# EasyEDA Pro project ProPrj_CactusConKids14_2026-02-14.epro, schematic Schematic1

## Sheets
1 1. MCU and Power: Board Name: CCK14 Fallback; Create Date: 2025-12-13; Page Name: 1. MCU and Power; Project Name: CactusConKids14; Schematic Name: Schematic1; Update Date: 2025-12-14; Company: EasyEDA.com; Page Size: A4; Version: V1.0
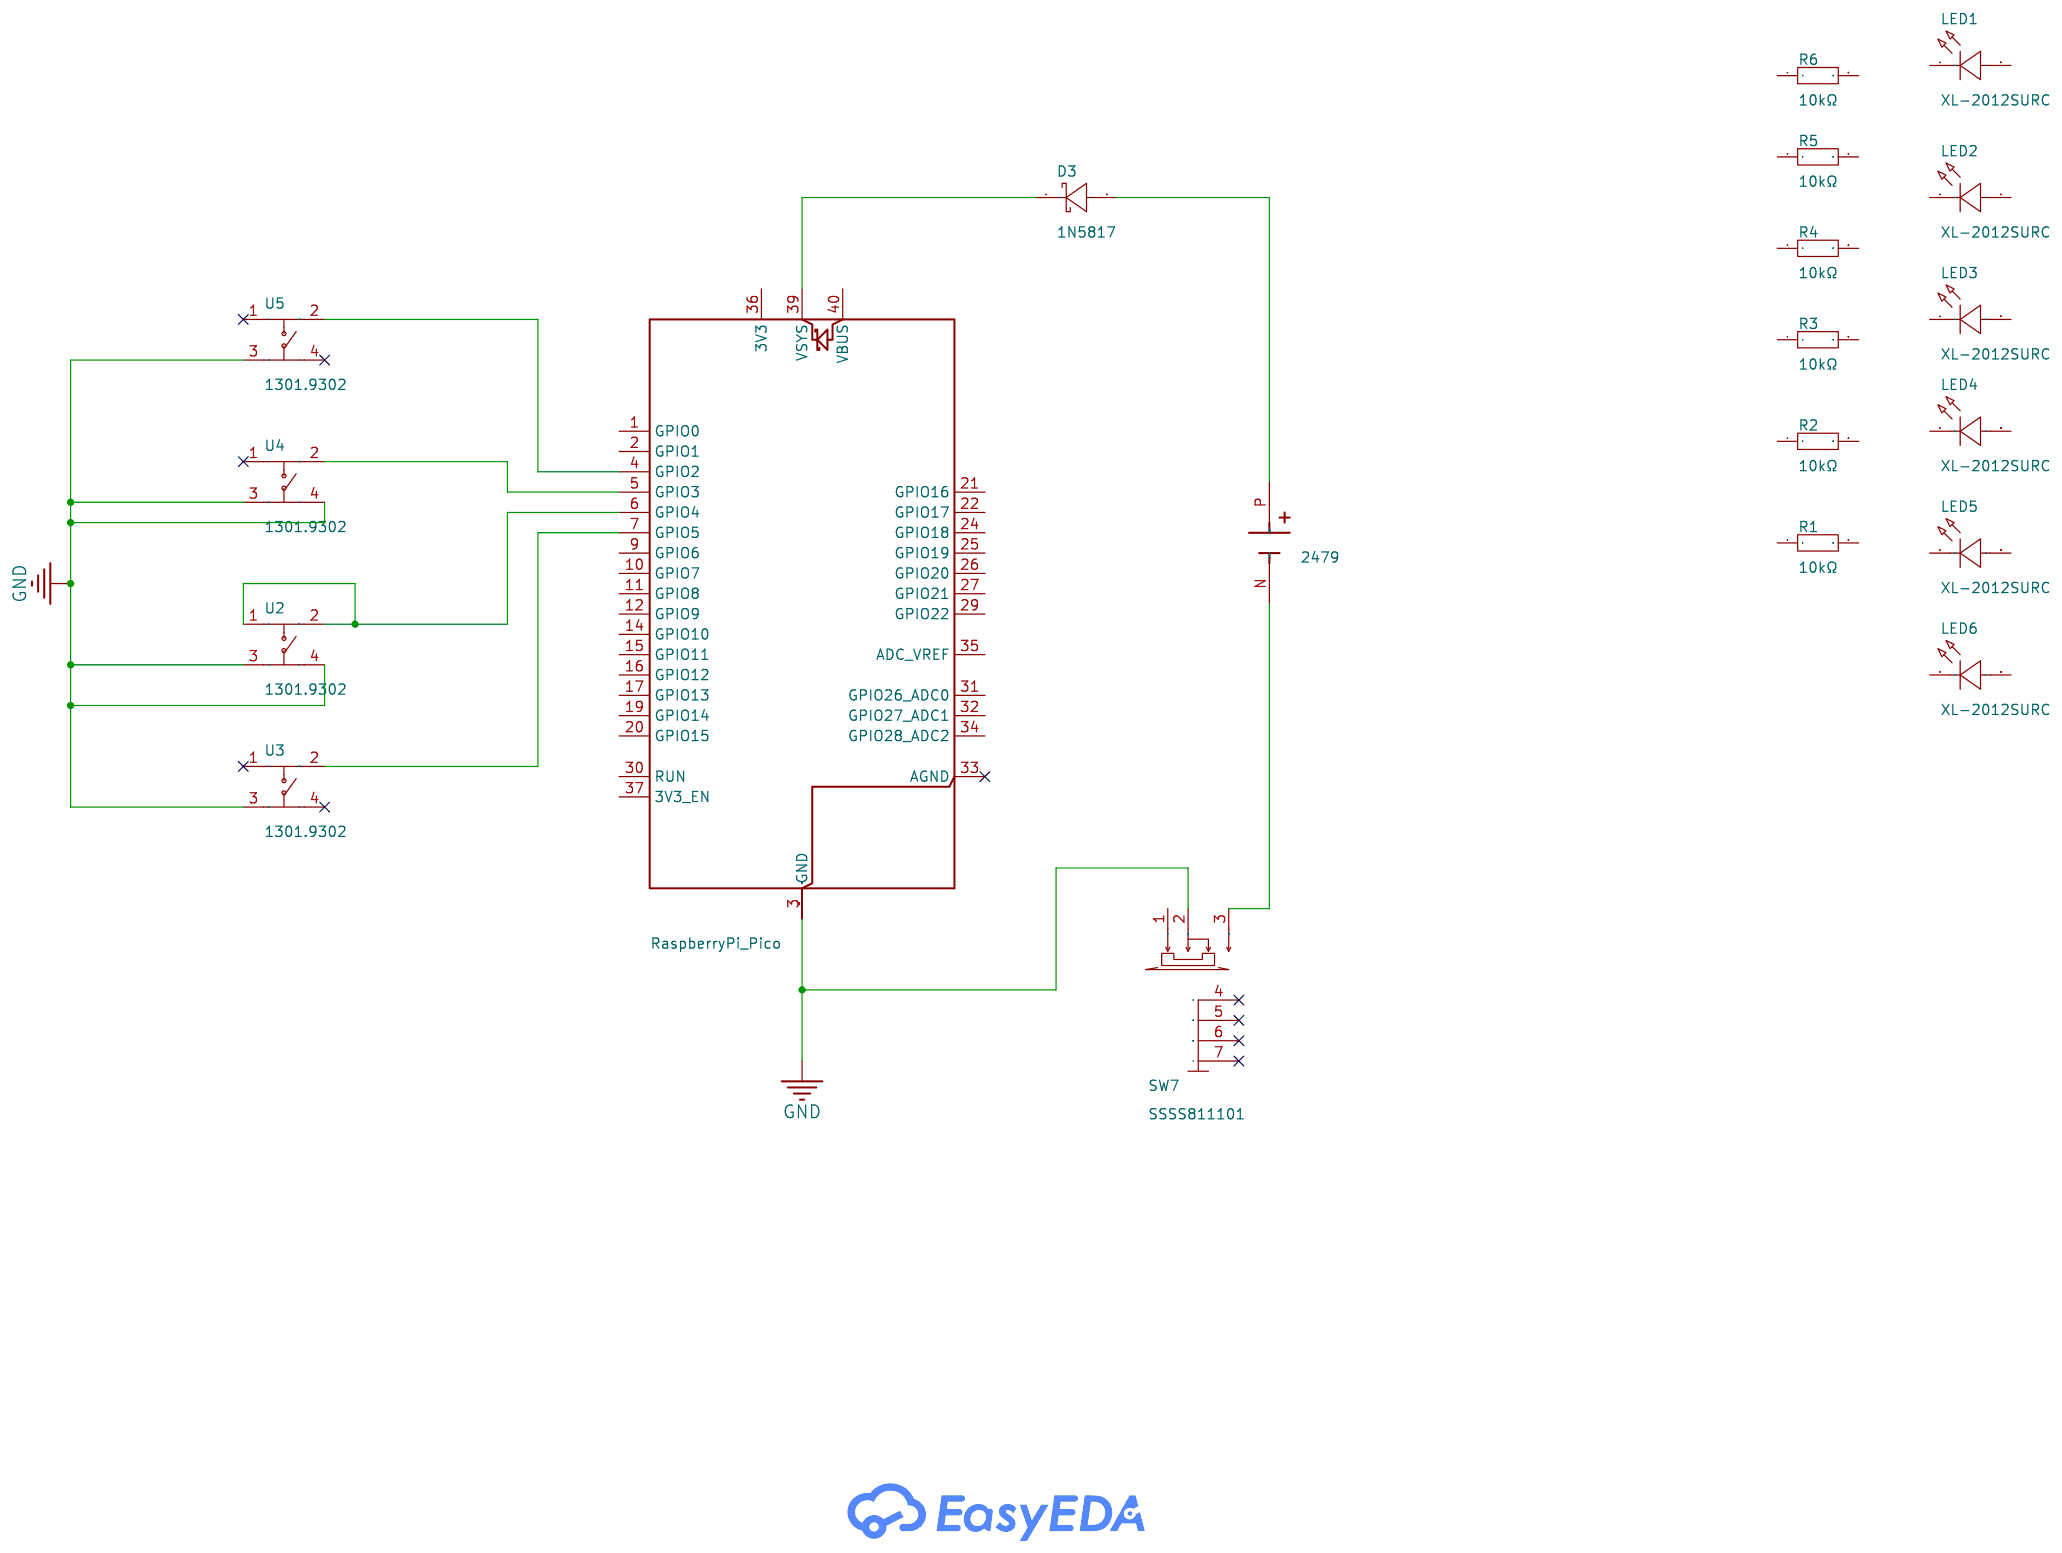
[diagram p3: 1. MCU and Power]
2 3. Breadboard and SAO: Create Date: 2025-12-14; Page Name: 3. Breadboard and SAO
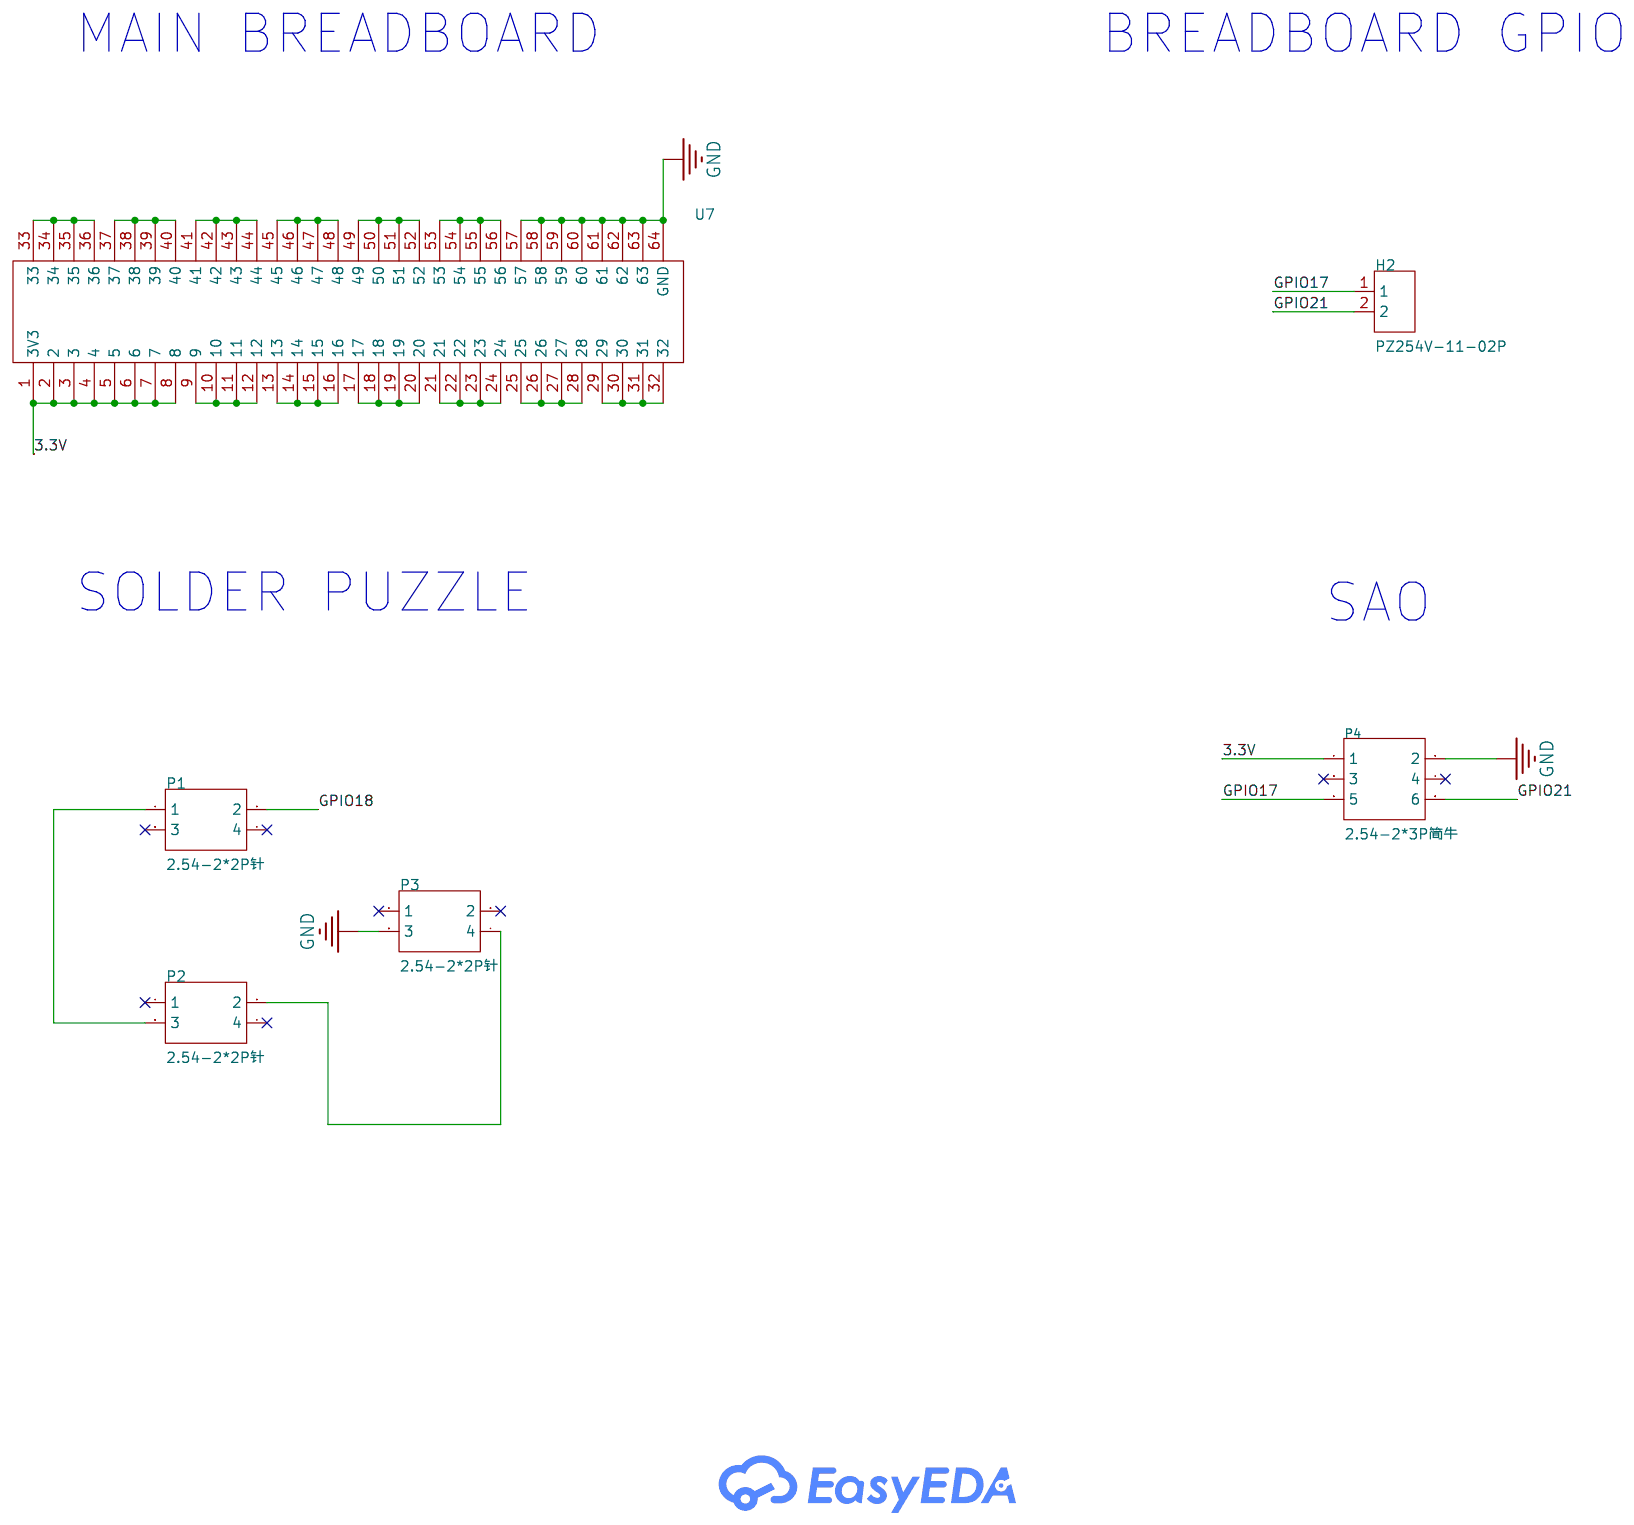
[diagram p4: 3. Breadboard and SAO]

## Parts
sheet 1. MCU and Power
D3  1N5817  [DO-41_BD2.4-L4.7-P8.70-D0.8-RD]
LED1  XL-2012SURC  [LED0805-RD_RED]
LED2  XL-2012SURC  [LED0805-RD_RED]
LED3  XL-2012SURC  [LED0805-RD_RED]
LED4  XL-2012SURC  [LED0805-RD_RED]
LED5  XL-2012SURC  [LED0805-RD_RED]
LED6  XL-2012SURC  [LED0805-RD_RED]
R1  10kΩ  [R0805]
R2  10kΩ  [R0805]
R3  10kΩ  [R0805]
R4  10kΩ  [R0805]
R5  10kΩ  [R0805]
R6  10kΩ  [R0805]
SW7  SSSS811101  [SW-SMD_SSSS811101]
U2  1301.9302  [KEY-TH_4P-L6.0-W6.0-P4.50-LS6.50]
U3  1301.9302  [KEY-TH_4P-L6.0-W6.0-P4.50-LS6.50]
U4  1301.9302  [KEY-TH_4P-L6.0-W6.0-P4.50-LS6.50]
U5  1301.9302  [KEY-TH_4P-L6.0-W6.0-P4.50-LS6.50]
U6  RaspberryPi_Pico  [RaspberryPi_Pico_Common_THT_MountingHoles]
U8  2479  [BAT_2479]
sheet 3. Breadboard and SAO
H2  PZ254V-11-02P  [HDR-TH_2P-P2.54-V-M]  (no BOM)
P1  2.54-2*2P针  [HDR-TH_4P-P2.54-V-M-R2-C2-S2.54-1]  (no BOM)
P2  2.54-2*2P针  [HDR-TH_4P-P2.54-V-M-R2-C2-S2.54-1]  (no BOM)
P3  2.54-2*2P针  [HDR-TH_4P-P2.54-V-M-R2-C2-S2.54-1]  (no BOM)
P4  2.54-2*3P简牛  [IDC-TH_6P-P2.54_C11214]  (no BOM)
U7  -  [Breadboard 8x8 3V3]  (no BOM)

## Library data of the parts
D3 = 1N5817_C7544876: Diode Configuration:Independent Voltage - Forward(Vf@If):450mV@1A Voltage - DC Reverse(Vr):20V Current - Rectified:1A Reverse Leakage Current (Ir):1mA@20V Operating Junction Temperature Range:-65℃~+125℃ Operating Junction Temperature Range:-65℃~+125℃ Non-; LCSC Part Name: 电压:20V 电流:1A; Supplier Part: C7544876; Manufacturer: LGE(鲁光); Supplier Footprint: DO-41; JLCPCB Part Class: Extended Part; Datasheet: https://item.szlcsc.com/datasheet/1N5817/8654312.html; Supplier: LCSC; Diode Configuration: Independent; Voltage - Forward(Vf@If): 450mV@1A; Voltage - DC Reverse(Vr): 20V; Current - Rectified: 1A; Reverse Leakage Current (Ir): 1mA@20V; Operating Junction Temperature Range: -65℃~+125℃; Non-Repetitive Peak Forward Surge Current: 30A
LED1-LED6 = XL-2012SURC: Lamp Holder Type:- Illumination Color:Red Voltage - Forward(Vf):2.3V Voltage - Forward(Vf):2.3V Power(Watts):- Forward Current:20mA Wavelength - Dominant:615nm~630nm Wavelength - Dominant:615nm~630nm Peak Wavelength:620nm Diode Configuration:- Lens Color:; LCSC Part Name: 0805红贴片式发光二极管; Supplier Part: C965812; Manufacturer: XINGLIGHT(成兴光); Supplier Footprint: 0805; JLCPCB Part Class: Extended Part; Datasheet: https://item.szlcsc.com/datasheet/XL-2012SURC/1051421.html; Supplier: LCSC; Illumination Color: Red; Voltage - Forward(Vf): 2.3V; Forward Current: 20mA; Wavelength - Dominant: 615nm~630nm; Peak Wavelength: 620nm; Lens Color: Water Clear; Luminous Intensity: 230mcd; Viewing Angle: 120°; Mounting Style: op View Mount
R1-R6 = 0805W8F1002T5E: Type:Thick Film Resistor Resistance:10kΩ Tolerance:±1% Tolerance:±1% Power(Watts):125mW Voltage-Supply(Max):150V Temperature Coefficient:±100ppm/℃ Temperature Coefficient:±100ppm/℃ Operating Temperature:-55℃~+155℃ Operating Temperature:-55℃~+155℃; LCSC Part Name: 10kΩ ±1% 125mW 厚膜电阻; Supplier Part: C17414; Manufacturer: UNI-ROYAL(厚声); Supplier Footprint: 0805; JLCPCB Part Class: Basic Part; Datasheet: https://item.szlcsc.com/datasheet/0805W8F1002T5E/18102.html; Supplier: LCSC; Type: Thick Film Resistor; Tolerance: ±1%; Power(Watts): 125mW; Voltage-Supply(Max): 150V; Temperature Coefficient: ±100ppm/℃; Operating Temperature: -55℃~+155℃
SW7 = SSSS811101: Circuit:SPDT Actuator Style:Rectangular Columnar Termination Style:SMD(SMT) Tab Switch Height:4.1mm Mounting Type:Surface Mount, Right Angle Current Rating:300mA Voltage Rating:5V Life:10,000 Cycles Operating Temperature:-40℃~+85℃ Operating Temperature:-4; Supplier Part: C109335; Manufacturer: ALPSALPINE(阿尔卑斯阿尔派); Supplier Footprint: SMD; JLCPCB Part Class: Extended Part; Datasheet: https://item.szlcsc.com/datasheet/SSSS811101/110556.html; Supplier: LCSC; Circuit: SPDT; Actuator Style: Rectangular Columnar; Termination Style: SMD(SMT) Tab; Switch Height: 4.1mm; Mounting Type: Surface Mount, Right Angle; Current Rating: 300mA; Voltage Rating: 5V; Life: 10,000 Cycles; Operating Temperature: -40℃~+85℃
U2-U5 = 1301.9302: Circuit:SPST Actuator Style:Round Button Operating Force:160gf Mounting Style:Direct Insert Contact Current:50mA Voltage Rating (DC):12V IP Rating:IP40 Pin Style:PCPin Mechanical Life:100000 Times Operating Temperature:-20℃~+70℃ Operating Temperature:-20℃; Supplier Part: C4364294; Manufacturer: SCHURTER; Supplier Footprint: 插件; JLCPCB Part Class: Extended Part; Datasheet: https://atta.szlcsc.com/upload/public/pdf/source/231023/typ_6x6_mm_tact_switches.pdf-655481d6cc136fce28200a4f59ef0234.pdf; Supplier: LCSC; Circuit: SPST; Actuator Style: Round Button; Operating Force: 160gf; Mounting Style: Direct Insert; Contact Current: 50mA; Voltage Rating (DC): 12V; IP Rating: IP40; Pin Style: PCPin; Mechanical Life: 100000 Times; Operating Temperature: -20℃~+70℃
U6 = RaspberryPi_Pico
U8 = 2479
H2 = PZ254V-11-02P: Pin Structure:1x2P Pitch:2.54mm Row Spacing:- Circluar Pins/Square Pins:Pin Header Mounting Type:Through Hole Number of Rows:1 Number of Pins:2P Current Rating:- Voltage Rating (Max):- Length of Mating Pin:6mm Insulation Height:2.5mm Length of End Connect; LCSC Part Name: 1x2P 间距:2.54mm 方针 直插; Supplier Part: C492401; Manufacturer: XFCN(兴飞); Supplier Footprint: 插件,P=2.54mm; JLCPCB Part Class: Extended Part; Datasheet: https://item.szlcsc.com/datasheet/PZ254V-11-02P/502957.html; Supplier: LCSC; Pin Structure: 1x2P; Pitch: 2.54mm; Circluar Pins/Square Pins: Pin Header; Mounting Type: Through Hole; Number of Rows: 1; Number of Pins: 2P; Length of Mating Pin: 6mm; Insulation Height: 2.5mm; Length of End Connection Pin: 3mm; Contact Material: Brass; Operating Temperature: -40℃~+105℃; Color: Black
P1-P3 = 2.54-2*2P针: Pin Structure:- Pitch:2.54mm Row Spacing:2.54mm Circluar Pins/Square Pins:Pin Header Mounting Type:Through Hole Number of Rows:2 Number of Pins:4P Current Rating:3A Voltage Rating (Max):- Length of Mating Pin:6mm Insulation Height:2.5mm Length of End Conn; LCSC Part Name: 间距:2.54mm 方针 直插; Supplier Part: C66690; Manufacturer: BOOMELE(博穆精密); Supplier Footprint: 插件,P=2.54mm; JLCPCB Part Class: Extended Part; Datasheet: https://item.szlcsc.com/datasheet/2.54-2*2P%25E9%2592%2588/67776.html; Supplier: LCSC; Pitch: 2.54mm; Row Spacing: 2.54mm; Circluar Pins/Square Pins: Pin Header; Mounting Type: Through Hole; Number of Rows: 2; Number of Pins: 4P; Current Rating: 3A; Length of Mating Pin: 6mm; Insulation Height: 2.5mm; Length of End Connection Pin: 3mm; Contact Material: Brass; Contact Plating: Gold; Operating Temperature: -55℃~+105℃; Color: Black
P4 = 2.54-2*3P简牛: Connector Type:IDC Header Pitch:2.54mm Holder Type:Through Hole Row Spacing:2.54mm Number of Rows:2 Contact Material:Brass Contact Plating:Gold; LCSC Part Name: 2.54mm 排数:2; Supplier Part: C11214; Manufacturer: BOOMELE(博穆精密); Supplier Footprint: 插件,P=2.54mm; JLCPCB Part Class: Extended Part; Datasheet: https://item.szlcsc.com/datasheet/2.54-2*3P%25E7%25AE%2580%25E7%2589%259B/11763.html; Supplier: LCSC; Connector Type: IDC Header; Pitch: 2.54mm; Holder Type: Through Hole; Row Spacing: 2.54mm; Number of Rows: 2; Contact Material: Brass; Contact Plating: Gold
U7 = Breadboard 8x8 3v3

## Nets
3.3V: P4.1 U7.1(3V3) U7.2 U7.3 U7.4 U7.5 U7.6 U7.7 U7.8
GND: P3.3 P4.2 SW7.2 U2.3 U2.4 U3.3 U4.3 U4.4 U5.3 U6.3(GND) U6.8(GND) U6.13(GND) U6.18(GND) U6.23(GND) U6.28(GND) U6.38(GND) U7.57 U7.58 U7.59 U7.60 U7.61 U7.62 U7.63 U7.64(GND)
GPIO17: H2.1 P4.5
GPIO18: P1.2
GPIO21: H2.2 P4.6
Net-(D3-1): D3.1(K) U6.39(VSYS)
Net-(D3-2): D3.2(A) U8.P
Net-(P1-1): P1.1 P2.3
Net-(P2-2): P2.2 P3.4
Net-(SW7-3): SW7.3 U8.N
Net-(U2-1): U2.1 U2.2 U6.6(GPIO4)
Net-(U3-2): U3.2 U6.7(GPIO5)
Net-(U4-2): U4.2 U6.5(GPIO3)
Net-(U5-2): U5.2 U6.4(GPIO2)
Net-(U7-9): U7.9 U7.10 U7.11 U7.12
Net-(U7-13): U7.13 U7.14 U7.15 U7.16
Net-(U7-17): U7.17 U7.18 U7.19 U7.20
Net-(U7-21): U7.21 U7.22 U7.23 U7.24
Net-(U7-25): U7.25 U7.26 U7.27 U7.28
Net-(U7-29): U7.29 U7.30 U7.31 U7.32
Net-(U7-33): U7.33 U7.34 U7.35 U7.36
Net-(U7-37): U7.37 U7.38 U7.39 U7.40
Net-(U7-41): U7.41 U7.42 U7.43 U7.44
Net-(U7-45): U7.45 U7.46 U7.47 U7.48
Net-(U7-49): U7.49 U7.50 U7.51 U7.52
Net-(U7-53): U7.53 U7.54 U7.55 U7.56

Not connected (* = marked no-connect by the designer): LED1 1(K) 2(A); LED2 1(K) 2(A); LED3 1(K) 2(A); LED4 1(K) 2(A); LED5 1(K) 2(A); LED6 1(K) 2(A); P1 3* 4*; P2 1* 4*; P3 1* 2*; P4 3* 4*; R1 1 2; R2 1 2; R3 1 2; R4 1 2; R5 1 2; R6 1 2; SW7 1 4* 5* 6* 7*; U3 1* 4*; U4 1*; U5 1* 4*; U6 1(GPIO0) 2(GPIO1) 9(GPIO6) 10(GPIO7) 11(GPIO8) 12(GPIO9) 14(GPIO10) 15(GPIO11) 16(GPIO12) 17(GPIO13) 19(GPIO14) 20(GPIO15) 21(GPIO16) 22(GPIO17) 24(GPIO18) 25(GPIO19) 26(GPIO20) 27(GPIO21) 29(GPIO22) 30(RUN) 31(GPIO26_ADC0) 32(GPIO27_ADC1) 33(AGND)* 34(GPIO28_ADC2) 35(ADC_VREF) 36(3V3) 37(3V3_EN) 40(VBUS)

## Notes on the sheets
sheet 2
- MAIN BREADBOARD
- BREADBOARD GPIO
- SOLDER PUZZLE
- SAO
